# Altium project Custom_Keyboard.PrjPcb (part 3 of 4)

## Sheet Mux_Sheet_1.SchDoc
size A4; SheetNumber: 8
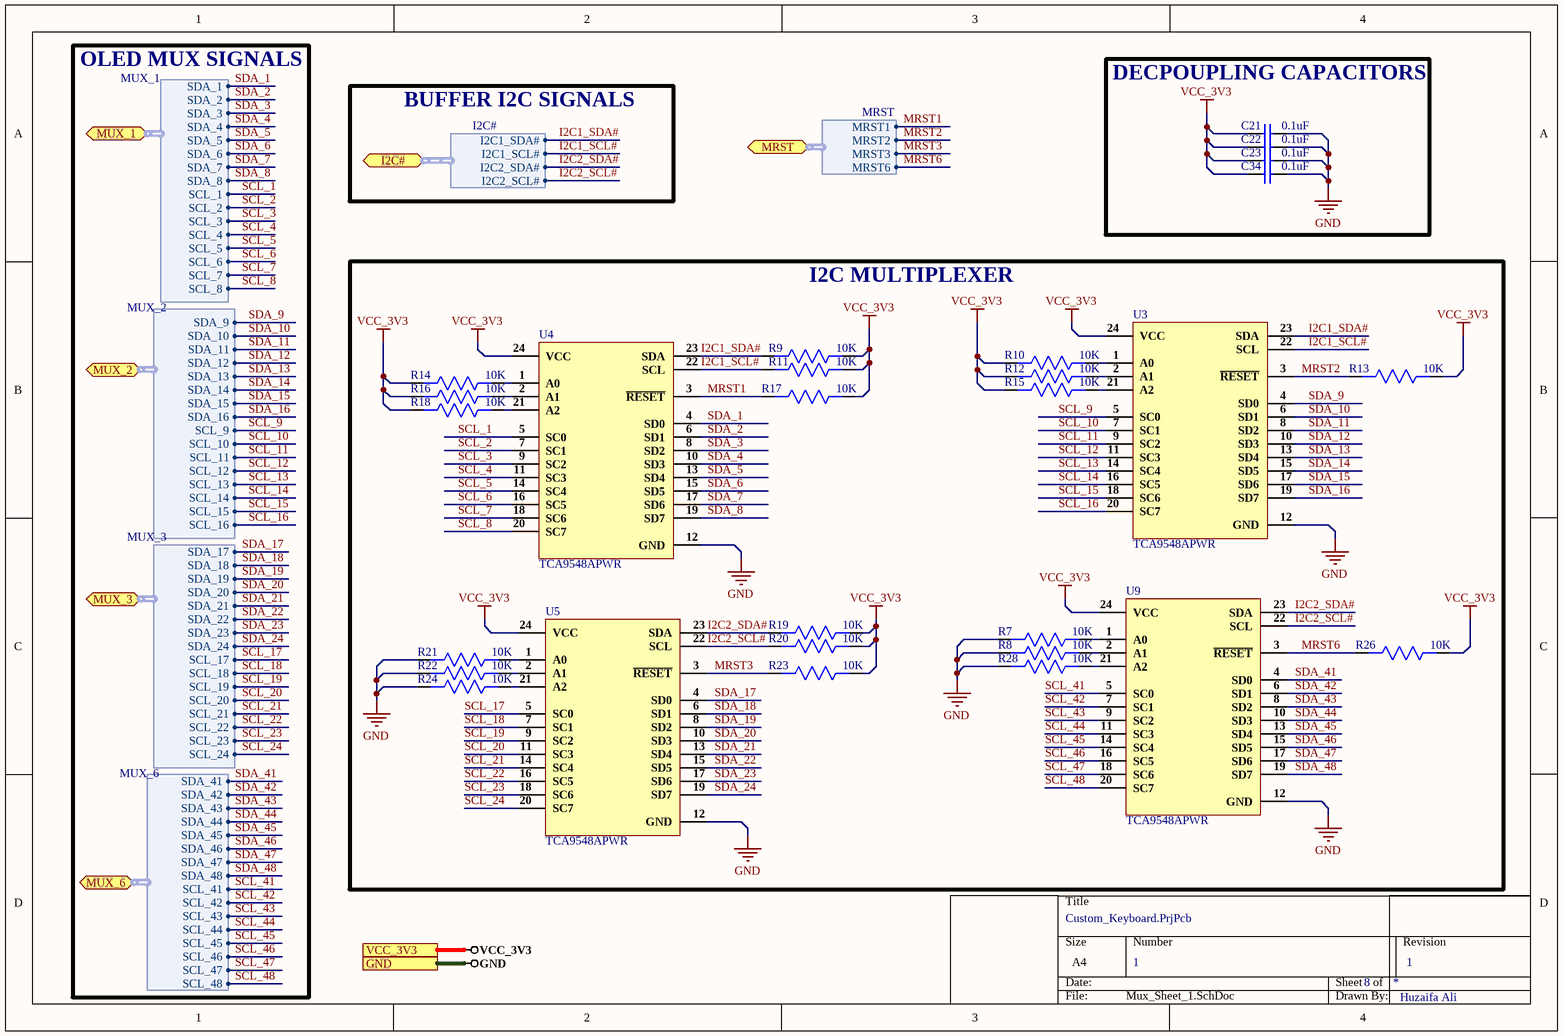
[diagram p9: Mux_Sheet_1.SchDoc]

### Parts
C21  0.1uF  [Cap0603]
C22  0.1uF  [Cap0603]
C23  0.1uF  [Cap0603]
C34  0.1uF  [Cap0603]
R7  10K  [Res0603]
R8  10K  [Res0603]
R9  10K  [Res0603]
R10  10K  [Res0603]
R11  10K  [Res0603]
R12  10K  [Res0603]
R13  10K  [Res0603]
R14  10K  [Res0603]
R15  10K  [Res0603]
R16  10K  [Res0603]
R17  10K  [Res0603]
R18  10K  [Res0603]
R19  10K  [Res0603]
R20  10K  [Res0603]
R21  10K  [Res0603]
R22  10K  [Res0603]
R23  10K  [Res0603]
R24  10K  [Res0603]
R26  10K  [Res0603]
R28  10K  [Res0603]
U3  TCA9548APWR  [24-TSSOP]
U4  TCA9548APWR  [24-TSSOP]
U5  TCA9548APWR  [24-TSSOP]
U9  TCA9548APWR  [24-TSSOP]

### Blocks framed on the sheet
DECPOUPLING CAPACITORS: C21-C23 C34
I2C MULTIPLEXER: R7-R24 R26 R28 U3-U5 U9

### Ports
GND, I2C# (bidir, harness I2C#), MRST (bidir, harness MRST), MUX_1 (bidir, harness MUX_1), MUX_2 (bidir, harness MUX_2), MUX_3 (bidir, harness MUX_3), MUX_6 (bidir, harness MUX_6), VCC_3V3

### Harnesses
MUX_1: SDA_1, SDA_2, SDA_3, SDA_4, SDA_5, SDA_6, SDA_7, SDA_8, SCL_1, SCL_2, SCL_3, SCL_4, SCL_5, SCL_6, SCL_7, SCL_8
MUX_2: SDA_9, SDA_10, SDA_11, SDA_12, SDA_13, SDA_14, SDA_15, SDA_16, SCL_9, SCL_10, SCL_11, SCL_12, SCL_13, SCL_14, SCL_15, SCL_16
MUX_3: SDA_17, SDA_18, SDA_19, SDA_20, SDA_21, SDA_22, SDA_23, SDA_24, SCL_17, SCL_18, SCL_19, SCL_20, SCL_21, SCL_22, SCL_23, SCL_24
I2C#: I2C1_SDA#, I2C1_SCL#, I2C2_SDA#, I2C2_SCL#
MRST: MRST1, MRST2, MRST3, MRST6
MUX_6: SDA_41, SDA_42, SDA_43, SDA_44, SDA_45, SDA_46, SDA_47, SDA_48, SCL_41, SCL_42, SCL_43, SCL_44, SCL_45, SCL_46, SCL_47, SCL_48

### Nets
GND: C21.2 C22.2 C23.2 C34.2 R7.2 R8.2 R21.2 R22.2 R24.2 R28.2 U3.12(GND) U4.12(GND) U5.12(GND) U9.12(GND) ; port GND
VCC_3V3: C21.1 C22.1 C23.1 C34.1 R9.1 R10.2 R11.1 R12.2 R13.1 R14.2 R15.2 R16.2 R17.1 R18.2 R19.1 R20.1 R23.1 R26.1 U3.24(VCC) U4.24(VCC) U5.24(VCC) U9.24(VCC) ; port VCC_3V3
I2C1_SCL#: R11.2 U3.22(SCL) U4.22(SCL) ; port I2C#.I2C1_SCL#  [project net I2C#.I2C1_SCL#]
I2C1_SDA#: R9.2 U3.23(SDA) U4.23(SDA) ; port I2C#.I2C1_SDA#  [project net I2C#.I2C1_SDA#]
I2C2_SCL#: R20.2 U5.22(SCL) U9.22(SCL) ; port I2C#.I2C2_SCL#  [project net I2C#.I2C2_SCL#]
I2C2_SDA#: R19.2 U5.23(SDA) U9.23(SDA) ; port I2C#.I2C2_SDA#  [project net I2C#.I2C2_SDA#]
MRST1: R17.2 U4.3(~{RESET}) ; port MRST.MRST1  [project net MRST.MRST1]
MRST2: R13.2 U3.3(~{RESET}) ; port MRST.MRST2  [project net MRST.MRST2]
MRST3: R23.2 U5.3(~{RESET}) ; port MRST.MRST3  [project net MRST.MRST3]
MRST6: R26.2 U9.3(~{RESET}) ; port MRST.MRST6  [project net MRST.MRST6]
SCL_1: U4.5(SC0) ; port MUX_1.SCL_1  [project net MUX_1.SCL_1]
SCL_2: U4.7(SC1) ; port MUX_1.SCL_2  [project net MUX_1.SCL_2]
SCL_3: U4.9(SC2) ; port MUX_1.SCL_3  [project net MUX_1.SCL_3]
SCL_4: U4.11(SC3) ; port MUX_1.SCL_4  [project net MUX_1.SCL_4]
SCL_5: U4.14(SC4) ; port MUX_1.SCL_5  [project net MUX_1.SCL_5]
SCL_6: U4.16(SC5) ; port MUX_1.SCL_6  [project net MUX_1.SCL_6]
SCL_7: U4.18(SC6) ; port MUX_1.SCL_7  [project net MUX_1.SCL_7]
SCL_8: U4.20(SC7) ; port MUX_1.SCL_8  [project net MUX_1.SCL_8]
SCL_9: U3.5(SC0) ; port MUX_2.SCL_9  [project net MUX_2.SCL_9]
SCL_10: U3.7(SC1) ; port MUX_2.SCL_10  [project net MUX_2.SCL_10]
SCL_11: U3.9(SC2) ; port MUX_2.SCL_11  [project net MUX_2.SCL_11]
SCL_12: U3.11(SC3) ; port MUX_2.SCL_12  [project net MUX_2.SCL_12]
SCL_13: U3.14(SC4) ; port MUX_2.SCL_13  [project net MUX_2.SCL_13]
SCL_14: U3.16(SC5) ; port MUX_2.SCL_14  [project net MUX_2.SCL_14]
SCL_15: U3.18(SC6) ; port MUX_2.SCL_15  [project net MUX_2.SCL_15]
SCL_16: U3.20(SC7) ; port MUX_2.SCL_16  [project net MUX_2.SCL_16]
SCL_17: U5.5(SC0) ; port MUX_3.SCL_17  [project net MUX_3.SCL_17]
SCL_18: U5.7(SC1) ; port MUX_3.SCL_18  [project net MUX_3.SCL_18]
SCL_19: U5.9(SC2) ; port MUX_3.SCL_19  [project net MUX_3.SCL_19]
SCL_20: U5.11(SC3) ; port MUX_3.SCL_20  [project net MUX_3.SCL_20]
SCL_21: U5.14(SC4) ; port MUX_3.SCL_21  [project net MUX_3.SCL_21]
SCL_22: U5.16(SC5) ; port MUX_3.SCL_22  [project net MUX_3.SCL_22]
SCL_23: U5.18(SC6) ; port MUX_3.SCL_23  [project net MUX_3.SCL_23]
SCL_24: U5.20(SC7) ; port MUX_3.SCL_24  [project net MUX_3.SCL_24]
SCL_41: U9.5(SC0) ; port MUX_6.SCL_41  [project net MUX_6.SCL_41]
SCL_42: U9.7(SC1) ; port MUX_6.SCL_42  [project net MUX_6.SCL_42]
SCL_43: U9.9(SC2) ; port MUX_6.SCL_43  [project net MUX_6.SCL_43]
SCL_44: U9.11(SC3) ; port MUX_6.SCL_44  [project net MUX_6.SCL_44]
SCL_45: U9.14(SC4) ; port MUX_6.SCL_45  [project net MUX_6.SCL_45]
SCL_46: U9.16(SC5) ; port MUX_6.SCL_46  [project net MUX_6.SCL_46]
SCL_47: U9.18(SC6) ; port MUX_6.SCL_47  [project net MUX_6.SCL_47]
SCL_48: U9.20(SC7) ; port MUX_6.SCL_48  [project net MUX_6.SCL_48]
SDA_1: U4.4(SD0) ; port MUX_1.SDA_1  [project net MUX_1.SDA_1]
SDA_2: U4.6(SD1) ; port MUX_1.SDA_2  [project net MUX_1.SDA_2]
SDA_3: U4.8(SD2) ; port MUX_1.SDA_3  [project net MUX_1.SDA_3]
SDA_4: U4.10(SD3) ; port MUX_1.SDA_4  [project net MUX_1.SDA_4]
SDA_5: U4.13(SD4) ; port MUX_1.SDA_5  [project net MUX_1.SDA_5]
SDA_6: U4.15(SD5) ; port MUX_1.SDA_6  [project net MUX_1.SDA_6]
SDA_7: U4.17(SD6) ; port MUX_1.SDA_7  [project net MUX_1.SDA_7]
SDA_8: U4.19(SD7) ; port MUX_1.SDA_8  [project net MUX_1.SDA_8]
SDA_9: U3.4(SD0) ; port MUX_2.SDA_9  [project net MUX_2.SDA_9]
SDA_10: U3.6(SD1) ; port MUX_2.SDA_10  [project net MUX_2.SDA_10]
SDA_11: U3.8(SD2) ; port MUX_2.SDA_11  [project net MUX_2.SDA_11]
SDA_12: U3.10(SD3) ; port MUX_2.SDA_12  [project net MUX_2.SDA_12]
SDA_13: U3.13(SD4) ; port MUX_2.SDA_13  [project net MUX_2.SDA_13]
SDA_14: U3.15(SD5) ; port MUX_2.SDA_14  [project net MUX_2.SDA_14]
SDA_15: U3.17(SD6) ; port MUX_2.SDA_15  [project net MUX_2.SDA_15]
SDA_16: U3.19(SD7) ; port MUX_2.SDA_16  [project net MUX_2.SDA_16]
SDA_17: U5.4(SD0) ; port MUX_3.SDA_17  [project net MUX_3.SDA_17]
SDA_18: U5.6(SD1) ; port MUX_3.SDA_18  [project net MUX_3.SDA_18]
SDA_19: U5.8(SD2) ; port MUX_3.SDA_19  [project net MUX_3.SDA_19]
SDA_20: U5.10(SD3) ; port MUX_3.SDA_20  [project net MUX_3.SDA_20]
SDA_21: U5.13(SD4) ; port MUX_3.SDA_21  [project net MUX_3.SDA_21]
SDA_22: U5.15(SD5) ; port MUX_3.SDA_22  [project net MUX_3.SDA_22]
SDA_23: U5.17(SD6) ; port MUX_3.SDA_23  [project net MUX_3.SDA_23]
SDA_24: U5.19(SD7) ; port MUX_3.SDA_24  [project net MUX_3.SDA_24]
SDA_41: U9.4(SD0) ; port MUX_6.SDA_41  [project net MUX_6.SDA_41]
SDA_42: U9.6(SD1) ; port MUX_6.SDA_42  [project net MUX_6.SDA_42]
SDA_43: U9.8(SD2) ; port MUX_6.SDA_43  [project net MUX_6.SDA_43]
SDA_44: U9.10(SD3) ; port MUX_6.SDA_44  [project net MUX_6.SDA_44]
SDA_45: U9.13(SD4) ; port MUX_6.SDA_45  [project net MUX_6.SDA_45]
SDA_46: U9.15(SD5) ; port MUX_6.SDA_46  [project net MUX_6.SDA_46]
SDA_47: U9.17(SD6) ; port MUX_6.SDA_47  [project net MUX_6.SDA_47]
SDA_48: U9.19(SD7) ; port MUX_6.SDA_48  [project net MUX_6.SDA_48]
NetR7_1: R7.1 U9.1(A0)
NetR8_1: R8.1 U9.2(A1)
NetR10_1: R10.1 U3.1(A0)
NetR12_1: R12.1 U3.2(A1)
NetR14_1: R14.1 U4.1(A0)
NetR15_1: R15.1 U3.21(A2)
NetR16_1: R16.1 U4.2(A1)
NetR18_1: R18.1 U4.21(A2)
NetR21_1: R21.1 U5.1(A0)
NetR22_1: R22.1 U5.2(A1)
NetR24_1: R24.1 U5.21(A2)
NetR28_1: R28.1 U9.21(A2)

### Notes on the sheet
- OLED MUX SIGNALS
- BUFFER I2C SIGNALS
- 1
- Huzaifa Ali

### Library data of the parts
C21-C23 C34 = CC0603ZRY5V9BB104: as C3 on sheet Controller_Section_1; Supplier 1: Digi-Key; Manufacturer Part Number: CC0603ZRY5V9BB104; Stock 1: 15000880; Pricing 1: 1=0.1, 10=0.075, 100=0.0334, 500=0.02386, 1000=0.01874 (USD); Mount: Surface Mount; Case/Package: 0603; Number of Pins: 2; Case Code (Metric): 1608; Case Code (Imperial): 0603; Min Operating Temperature: -30°C; Max Operating Temperature: 85°C; Dielectric: Y5V; Voltage Rating: 50V; Package Quantity: 1; Packaging: Tape and Reel; Voltage Rating (DC): 50V; Termination: SMD/SMT; Composition: Ceramic; Voltage: 50V; Length: 1.6mm; Height: 0.8mm; Width: 0.031inch; Thickness: 0.035inch; Depth: 0.8mm; Radiation Hardening: No; REACH SVHC: No SVHC; Lead Free: Lead Free; Halogen Free: Halogen Free; ComponentLink1URL: http://www.yageo.com/documents/recent/UPY-GPHC_Y5V_6.3V-to-50V_8.pdf?src-supplier=Digi-Key; ComponentLink1Description: http://www.yageo.com/documents/recent/UPY-GPHC_Y5V_6.3V-to-50V_8.pdf?src-supplier=Digi-Key; ComponentLink2URL: http://www.yageo.com/documents/recent/UPY-GPHC_Y5V_6.3V-to-50V_5.pdf?src-supplier=Avnet+Europe; ComponentLink2Description: http://www.yageo.com/documents/recent/UPY-GPHC_Y5V_6.3V-to-50V_5.pdf?src-supplier=Avnet+Europe; ComponentLink3URL: https://www.verical.com/server-webapp/html/getDatasheet?partID=403611&src-supplier=Verical; ComponentLink3Description: https://www.verical.com/server-webapp/html/getDatasheet?partID=403611&src-supplier=Verical; ComponentLink4URL: http://www.mouser.com/ds/2/447/Yageo_UPY-GP_NP0_16V-to-50V_9-358835.pdf?src-supplier=Mouser; ComponentLink4Description: http://www.mouser.com/ds/2/447/Yageo_UPY-GP_NP0_16V-to-50V_9-358835.pdf?src-supplier=Mouser; ComponentLink5URL: http://www.farnell.com/datasheets/1132289.pdf?src-supplier=Element14; ComponentLink5Description: http://www.farnell.com/datasheets/1132289.pdf?src-supplier=Element14; Supplier Part Number 1: 311-1343-1-ND
R7-R24 R26 R28 = AC0603JR-0710KL: as R2 on sheet Controller_Section_1; Supplier 1: Future Electronics; Manufacturer Part Number: AC0603JR-0710KL; RoHS: Yes; Category: Chip SMD Resistors; Stock 1: 1533000; Pricing 1: 5000=0.00540 (USD); Case/Package: 0603; Case Code (Imperial): 0603; Case Code (Metric): 1608; Size Code: 0603; Min Operating Temperature: -55°C; Max Operating Temperature: 155°C; Packaging: Tape and Reel; Tolerance: 5%; Package Quantity: 1; Resistor Type: Thick Film; Termination: SMD/SMT; Number of Terminations: 2; Max Power Dissipation: 100mW; Features: Moisture Resistant,Automotive AEC-Q200,Anti-Sulfur; Series: AC; Construction: Rectangular; Length: 0.063inch; Width: 0.031inch; Height: 0.022inch; Depth: 0.8mm; Military Standard: Not; Lead Free: Lead Free; RoHS Compliant: Yes; ComponentLink1URL: https://datasheet.ciiva.com/5562/pyu-ac-51-rohs-l-2-5562553.pdf?src-supplier=Mouser; ComponentLink1Description: https://datasheet.ciiva.com/5562/pyu-ac-51-rohs-l-2-5562553.pdf?src-supplier=Mouser; Supplier Part Number 1: 1029044
U3-U5 U9 = TCA9548APWR: IC BUS SWITCH 1 X 8:1 24TSSOP; Manufacturer: Texas Instruments; Max Supply Voltage: 5.5V; Min Supply Voltage: 1.65V; On-State Resistance: 70R; Max Supply Current: 80uA; Supply Type: Single; Independent Circuits: 1; Supplier 1: Digi-Key; Manufacturer Part Number: TCA9548APWR; RoHS: Yes; Category: Decoders and Multiplexers; Pricing 1: 1=2.09000, 10=1.87600, 25=1.77040, 100=1.50820, 250=1.41616, 500=1.23914, 1000=1.16900 (USD); Mount: Surface Mount; Case/Package: TSSOP; Number of Pins: 24; Contact Plating: Gold; Min Operating Temperature: -40°C; Max Operating Temperature: 85°C; Packaging: Tape and Reel; Package Quantity: 1; REACH SVHC: No SVHC; Lead Free: Lead Free; ComponentLink1URL: https://datasheet.ciiva.com/6614/tca9548a-6614721.pdf?src-supplier=Digi-Key; ComponentLink1Description: https://datasheet.ciiva.com/6614/tca9548a-6614721.pdf?src-supplier=Digi-Key; Supplier Part Number 1: 296-34905-1-ND

## Sheet Mux_Sheet_2.SchDoc
size A4; SheetNumber: 9
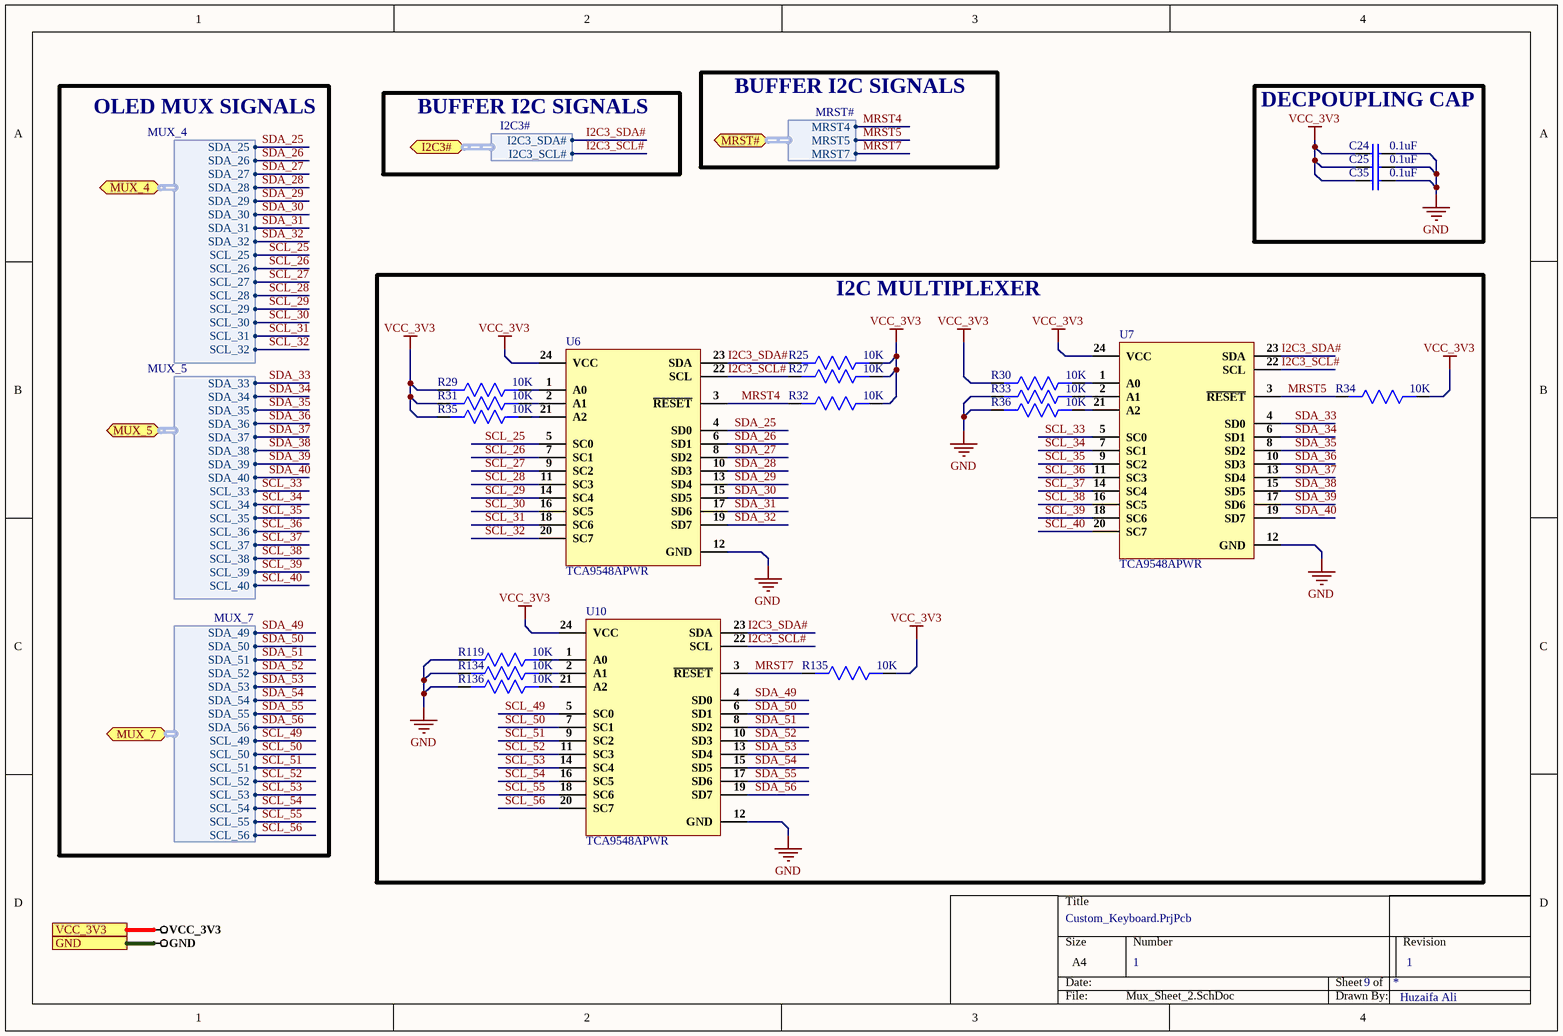
[diagram p10: Mux_Sheet_2.SchDoc]

### Parts
C24  0.1uF  [Cap0603]
C25  0.1uF  [Cap0603]
C35  0.1uF  [Cap0603]
R25  10K  [Res0603]
R27  10K  [Res0603]
R29  10K  [Res0603]
R30  10K  [Res0603]
R31  10K  [Res0603]
R32  10K  [Res0603]
R33  10K  [Res0603]
R34  10K  [Res0603]
R35  10K  [Res0603]
R36  10K  [Res0603]
R119  10K  [Res0603]
R134  10K  [Res0603]
R135  10K  [Res0603]
R136  10K  [Res0603]
U6  TCA9548APWR  [24-TSSOP]
U7  TCA9548APWR  [24-TSSOP]
U10  TCA9548APWR  [24-TSSOP]

### Blocks framed on the sheet
DECPOUPLING CAP: C24 C25 C35
I2C MULTIPLEXER: R25 R27 R29-R36 R119 R134-R136 U6 U7 U10

### Ports
GND, I2C3# (bidir, harness I2C3#), MRST# (bidir, harness MRST#), MUX_4 (bidir, harness MUX_4), MUX_5 (bidir, harness MUX_5), MUX_7 (bidir, harness MUX_7), VCC_3V3

### Harnesses
MUX_4: SDA_25, SDA_26, SDA_27, SDA_28, SDA_29, SDA_30, SDA_31, SDA_32, SCL_25, SCL_26, SCL_27, SCL_28, SCL_29, SCL_30, SCL_31, SCL_32
I2C3#: I2C3_SDA#, I2C3_SCL#
MUX_5: SDA_33, SDA_34, SDA_35, SDA_36, SDA_37, SDA_38, SDA_39, SDA_40, SCL_33, SCL_34, SCL_35, SCL_36, SCL_37, SCL_38, SCL_39, SCL_40
MUX_7: SDA_49, SDA_50, SDA_51, SDA_52, SDA_53, SDA_54, SDA_55, SDA_56, SCL_49, SCL_50, SCL_51, SCL_52, SCL_53, SCL_54, SCL_55, SCL_56
MRST#: MRST4, MRST5, MRST7

### Nets
GND: C24.2 C25.2 C35.2 R33.2 R36.2 R119.2 R134.2 R136.2 U6.12(GND) U7.12(GND) U10.12(GND) ; port GND
VCC_3V3: C24.1 C25.1 C35.1 R25.1 R27.1 R29.2 R30.2 R31.2 R32.1 R34.1 R35.2 R135.1 U6.24(VCC) U7.24(VCC) U10.24(VCC) ; port VCC_3V3
I2C3_SCL#: R27.2 U6.22(SCL) U7.22(SCL) U10.22(SCL) ; port I2C3#.I2C3_SCL#  [project net I2C3#.I2C3_SCL#]
I2C3_SDA#: R25.2 U6.23(SDA) U7.23(SDA) U10.23(SDA) ; port I2C3#.I2C3_SDA#  [project net I2C3#.I2C3_SDA#]
MRST4: R32.2 U6.3(~{RESET}) ; port MRST#.MRST4  [project net MRST#.MRST4]
MRST5: R34.2 U7.3(~{RESET}) ; port MRST#.MRST5  [project net MRST#.MRST5]
MRST7: R135.2 U10.3(~{RESET}) ; port MRST#.MRST7  [project net MRST#.MRST7]
SCL_25: U6.5(SC0) ; port MUX_4.SCL_25  [project net MUX_4.SCL_25]
SCL_26: U6.7(SC1) ; port MUX_4.SCL_26  [project net MUX_4.SCL_26]
SCL_27: U6.9(SC2) ; port MUX_4.SCL_27  [project net MUX_4.SCL_27]
SCL_28: U6.11(SC3) ; port MUX_4.SCL_28  [project net MUX_4.SCL_28]
SCL_29: U6.14(SC4) ; port MUX_4.SCL_29  [project net MUX_4.SCL_29]
SCL_30: U6.16(SC5) ; port MUX_4.SCL_30  [project net MUX_4.SCL_30]
SCL_31: U6.18(SC6) ; port MUX_4.SCL_31  [project net MUX_4.SCL_31]
SCL_32: U6.20(SC7) ; port MUX_4.SCL_32  [project net MUX_4.SCL_32]
SCL_33: U7.5(SC0) ; port MUX_5.SCL_33  [project net MUX_5.SCL_33]
SCL_34: U7.7(SC1) ; port MUX_5.SCL_34  [project net MUX_5.SCL_34]
SCL_35: U7.9(SC2) ; port MUX_5.SCL_35  [project net MUX_5.SCL_35]
SCL_36: U7.11(SC3) ; port MUX_5.SCL_36  [project net MUX_5.SCL_36]
SCL_37: U7.14(SC4) ; port MUX_5.SCL_37  [project net MUX_5.SCL_37]
SCL_38: U7.16(SC5) ; port MUX_5.SCL_38  [project net MUX_5.SCL_38]
SCL_39: U7.18(SC6) ; port MUX_5.SCL_39  [project net MUX_5.SCL_39]
SCL_40: U7.20(SC7) ; port MUX_5.SCL_40  [project net MUX_5.SCL_40]
SCL_49: U10.5(SC0) ; port MUX_7.SCL_49  [project net MUX_7.SCL_49]
SCL_50: U10.7(SC1) ; port MUX_7.SCL_50  [project net MUX_7.SCL_50]
SCL_51: U10.9(SC2) ; port MUX_7.SCL_51  [project net MUX_7.SCL_51]
SCL_52: U10.11(SC3) ; port MUX_7.SCL_52  [project net MUX_7.SCL_52]
SCL_53: U10.14(SC4) ; port MUX_7.SCL_53  [project net MUX_7.SCL_53]
SCL_54: U10.16(SC5) ; port MUX_7.SCL_54  [project net MUX_7.SCL_54]
SCL_55: U10.18(SC6) ; port MUX_7.SCL_55  [project net MUX_7.SCL_55]
SCL_56: U10.20(SC7) ; port MUX_7.SCL_56  [project net MUX_7.SCL_56]
SDA_25: U6.4(SD0) ; port MUX_4.SDA_25  [project net MUX_4.SDA_25]
SDA_26: U6.6(SD1) ; port MUX_4.SDA_26  [project net MUX_4.SDA_26]
SDA_27: U6.8(SD2) ; port MUX_4.SDA_27  [project net MUX_4.SDA_27]
SDA_28: U6.10(SD3) ; port MUX_4.SDA_28  [project net MUX_4.SDA_28]
SDA_29: U6.13(SD4) ; port MUX_4.SDA_29  [project net MUX_4.SDA_29]
SDA_30: U6.15(SD5) ; port MUX_4.SDA_30  [project net MUX_4.SDA_30]
SDA_31: U6.17(SD6) ; port MUX_4.SDA_31  [project net MUX_4.SDA_31]
SDA_32: U6.19(SD7) ; port MUX_4.SDA_32  [project net MUX_4.SDA_32]
SDA_33: U7.4(SD0) ; port MUX_5.SDA_33  [project net MUX_5.SDA_33]
SDA_34: U7.6(SD1) ; port MUX_5.SDA_34  [project net MUX_5.SDA_34]
SDA_35: U7.8(SD2) ; port MUX_5.SDA_35  [project net MUX_5.SDA_35]
SDA_36: U7.10(SD3) ; port MUX_5.SDA_36  [project net MUX_5.SDA_36]
SDA_37: U7.13(SD4) ; port MUX_5.SDA_37  [project net MUX_5.SDA_37]
SDA_38: U7.15(SD5) ; port MUX_5.SDA_38  [project net MUX_5.SDA_38]
SDA_39: U7.17(SD6) ; port MUX_5.SDA_39  [project net MUX_5.SDA_39]
SDA_40: U7.19(SD7) ; port MUX_5.SDA_40  [project net MUX_5.SDA_40]
SDA_49: U10.4(SD0) ; port MUX_7.SDA_49  [project net MUX_7.SDA_49]
SDA_50: U10.6(SD1) ; port MUX_7.SDA_50  [project net MUX_7.SDA_50]
SDA_51: U10.8(SD2) ; port MUX_7.SDA_51  [project net MUX_7.SDA_51]
SDA_52: U10.10(SD3) ; port MUX_7.SDA_52  [project net MUX_7.SDA_52]
SDA_53: U10.13(SD4) ; port MUX_7.SDA_53  [project net MUX_7.SDA_53]
SDA_54: U10.15(SD5) ; port MUX_7.SDA_54  [project net MUX_7.SDA_54]
SDA_55: U10.17(SD6) ; port MUX_7.SDA_55  [project net MUX_7.SDA_55]
SDA_56: U10.19(SD7) ; port MUX_7.SDA_56  [project net MUX_7.SDA_56]
NetR29_1: R29.1 U6.1(A0)
NetR30_1: R30.1 U7.1(A0)
NetR31_1: R31.1 U6.2(A1)
NetR33_1: R33.1 U7.2(A1)
NetR35_1: R35.1 U6.21(A2)
NetR36_1: R36.1 U7.21(A2)
NetR119_1: R119.1 U10.1(A0)
NetR134_1: R134.1 U10.2(A1)
NetR136_1: R136.1 U10.21(A2)

### Notes on the sheet
- OLED MUX SIGNALS
- BUFFER I2C SIGNALS
- 1
- Huzaifa Ali

### Library data of the parts
C24 C25 C35 = CC0603ZRY5V9BB104: as C3 on sheet Controller_Section_1; Supplier 1: Digi-Key; Manufacturer Part Number: CC0603ZRY5V9BB104; Stock 1: 15000880; Pricing 1: 1=0.1, 10=0.075, 100=0.0334, 500=0.02386, 1000=0.01874 (USD); Mount: Surface Mount; Case/Package: 0603; Number of Pins: 2; Case Code (Metric): 1608; Case Code (Imperial): 0603; Min Operating Temperature: -30°C; Max Operating Temperature: 85°C; Dielectric: Y5V; Voltage Rating: 50V; Package Quantity: 1; Packaging: Tape and Reel; Voltage Rating (DC): 50V; Termination: SMD/SMT; Composition: Ceramic; Voltage: 50V; Length: 1.6mm; Height: 0.8mm; Width: 0.031inch; Thickness: 0.035inch; Depth: 0.8mm; Radiation Hardening: No; REACH SVHC: No SVHC; Lead Free: Lead Free; Halogen Free: Halogen Free; ComponentLink1URL: http://www.yageo.com/documents/recent/UPY-GPHC_Y5V_6.3V-to-50V_8.pdf?src-supplier=Digi-Key; ComponentLink1Description: http://www.yageo.com/documents/recent/UPY-GPHC_Y5V_6.3V-to-50V_8.pdf?src-supplier=Digi-Key; ComponentLink2URL: http://www.yageo.com/documents/recent/UPY-GPHC_Y5V_6.3V-to-50V_5.pdf?src-supplier=Avnet+Europe; ComponentLink2Description: http://www.yageo.com/documents/recent/UPY-GPHC_Y5V_6.3V-to-50V_5.pdf?src-supplier=Avnet+Europe; ComponentLink3URL: https://www.verical.com/server-webapp/html/getDatasheet?partID=403611&src-supplier=Verical; ComponentLink3Description: https://www.verical.com/server-webapp/html/getDatasheet?partID=403611&src-supplier=Verical; ComponentLink4URL: http://www.mouser.com/ds/2/447/Yageo_UPY-GP_NP0_16V-to-50V_9-358835.pdf?src-supplier=Mouser; ComponentLink4Description: http://www.mouser.com/ds/2/447/Yageo_UPY-GP_NP0_16V-to-50V_9-358835.pdf?src-supplier=Mouser; ComponentLink5URL: http://www.farnell.com/datasheets/1132289.pdf?src-supplier=Element14; ComponentLink5Description: http://www.farnell.com/datasheets/1132289.pdf?src-supplier=Element14; Supplier Part Number 1: 311-1343-1-ND
R25 R27 R29-R36 R119 R134-R136 = AC0603JR-0710KL: as R2 on sheet Controller_Section_1; Supplier 1: Future Electronics; Manufacturer Part Number: AC0603JR-0710KL; RoHS: Yes; Category: Chip SMD Resistors; Stock 1: 1533000; Pricing 1: 5000=0.00540 (USD); Case/Package: 0603; Case Code (Imperial): 0603; Case Code (Metric): 1608; Size Code: 0603; Min Operating Temperature: -55°C; Max Operating Temperature: 155°C; Packaging: Tape and Reel; Tolerance: 5%; Package Quantity: 1; Resistor Type: Thick Film; Termination: SMD/SMT; Number of Terminations: 2; Max Power Dissipation: 100mW; Features: Moisture Resistant,Automotive AEC-Q200,Anti-Sulfur; Series: AC; Construction: Rectangular; Length: 0.063inch; Width: 0.031inch; Height: 0.022inch; Depth: 0.8mm; Military Standard: Not; Lead Free: Lead Free; RoHS Compliant: Yes; ComponentLink1URL: https://datasheet.ciiva.com/5562/pyu-ac-51-rohs-l-2-5562553.pdf?src-supplier=Mouser; ComponentLink1Description: https://datasheet.ciiva.com/5562/pyu-ac-51-rohs-l-2-5562553.pdf?src-supplier=Mouser; Supplier Part Number 1: 1029044
U6 U7 U10 = TCA9548APWR: as U3 on sheet Mux_Sheet_1; Supplier 1: Digi-Key; Manufacturer Part Number: TCA9548APWR; RoHS: Yes; Category: Decoders and Multiplexers; Pricing 1: 1=2.09000, 10=1.87600, 25=1.77040, 100=1.50820, 250=1.41616, 500=1.23914, 1000=1.16900 (USD); Mount: Surface Mount; Case/Package: TSSOP; Number of Pins: 24; Contact Plating: Gold; Min Operating Temperature: -40°C; Max Operating Temperature: 85°C; Packaging: Tape and Reel; Package Quantity: 1; REACH SVHC: No SVHC; Lead Free: Lead Free; ComponentLink1URL: https://datasheet.ciiva.com/6614/tca9548a-6614721.pdf?src-supplier=Digi-Key; ComponentLink1Description: https://datasheet.ciiva.com/6614/tca9548a-6614721.pdf?src-supplier=Digi-Key; Supplier Part Number 1: 296-34905-1-ND

## Sheet RPull_Section.SchDoc
size A4; SheetNumber: 10
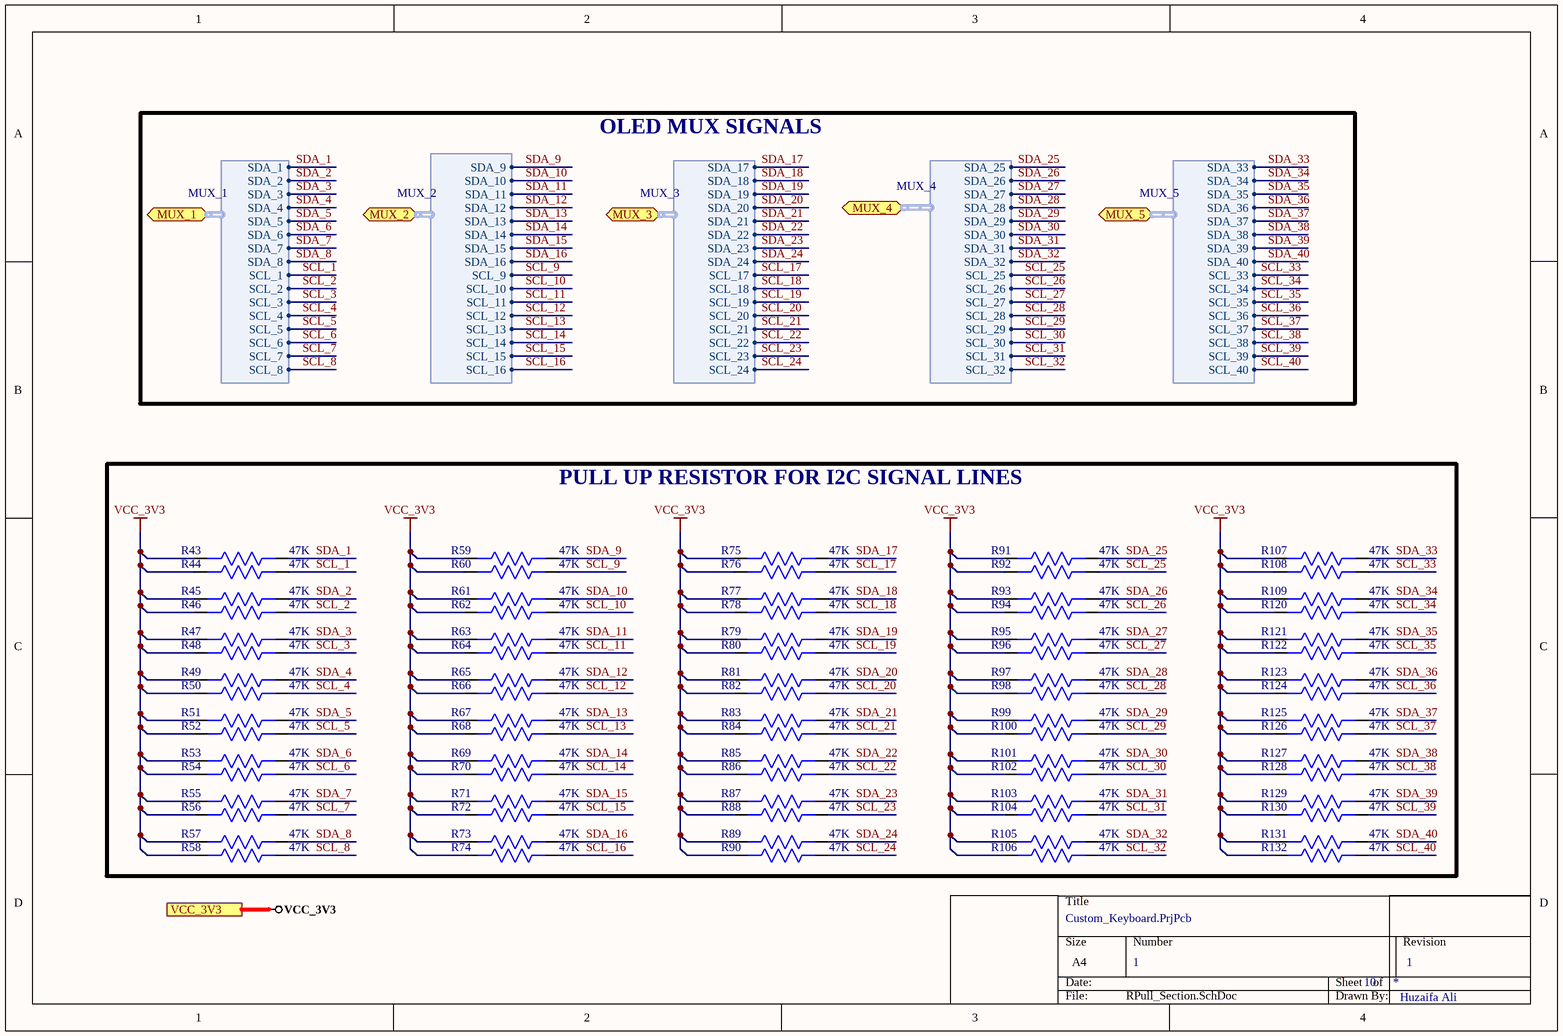
[diagram p11: RPull_Section.SchDoc]

### Parts
R43  47K  [Res0402]
R44  47K  [Res0402]
R45  47K  [Res0402]
R46  47K  [Res0402]
R47  47K  [Res0402]
R48  47K  [Res0402]
R49  47K  [Res0402]
R50  47K  [Res0402]
R51  47K  [Res0402]
R52  47K  [Res0402]
R53  47K  [Res0402]
R54  47K  [Res0402]
R55  47K  [Res0402]
R56  47K  [Res0402]
R57  47K  [Res0402]
R58  47K  [Res0402]
R59  47K  [Res0402]
R60  47K  [Res0402]
R61  47K  [Res0402]
R62  47K  [Res0402]
R63  47K  [Res0402]
R64  47K  [Res0402]
R65  47K  [Res0402]
R66  47K  [Res0402]
R67  47K  [Res0402]
R68  47K  [Res0402]
R69  47K  [Res0402]
R70  47K  [Res0402]
R71  47K  [Res0402]
R72  47K  [Res0402]
R73  47K  [Res0402]
R74  47K  [Res0402]
R75  47K  [Res0402]
R76  47K  [Res0402]
R77  47K  [Res0402]
R78  47K  [Res0402]
R79  47K  [Res0402]
R80  47K  [Res0402]
R81  47K  [Res0402]
R82  47K  [Res0402]
R83  47K  [Res0402]
R84  47K  [Res0402]
R85  47K  [Res0402]
R86  47K  [Res0402]
R87  47K  [Res0402]
R88  47K  [Res0402]
R89  47K  [Res0402]
R90  47K  [Res0402]
R91  47K  [Res0402]
R92  47K  [Res0402]
R93  47K  [Res0402]
R94  47K  [Res0402]
R95  47K  [Res0402]
R96  47K  [Res0402]
R97  47K  [Res0402]
R98  47K  [Res0402]
R99  47K  [Res0402]
R100  47K  [Res0402]
R101  47K  [Res0402]
R102  47K  [Res0402]
R103  47K  [Res0402]
R104  47K  [Res0402]
R105  47K  [Res0402]
R106  47K  [Res0402]
R107  47K  [Res0402]
R108  47K  [Res0402]
R109  47K  [Res0402]
R120  47K  [Res0402]
R121  47K  [Res0402]
R122  47K  [Res0402]
R123  47K  [Res0402]
R124  47K  [Res0402]
R125  47K  [Res0402]
R126  47K  [Res0402]
R127  47K  [Res0402]
R128  47K  [Res0402]
R129  47K  [Res0402]
R130  47K  [Res0402]
R131  47K  [Res0402]
R132  47K  [Res0402]

### Blocks framed on the sheet
PULL UP RESISTOR FOR I2C SIGNAL LINES: R43-R109 R120-R132

### Ports
MUX_1 (bidir, harness MUX_1), MUX_2 (bidir, harness MUX_2), MUX_3 (bidir, harness MUX_3), MUX_4 (bidir, harness MUX_4), MUX_5 (bidir, harness MUX_5), VCC_3V3

### Harnesses
MUX_4: SDA_25, SDA_26, SDA_27, SDA_28, SDA_29, SDA_30, SDA_31, SDA_32, SCL_25, SCL_26, SCL_27, SCL_28, SCL_29, SCL_30, SCL_31, SCL_32
MUX_5: SDA_33, SDA_34, SDA_35, SDA_36, SDA_37, SDA_38, SDA_39, SDA_40, SCL_33, SCL_34, SCL_35, SCL_36, SCL_37, SCL_38, SCL_39, SCL_40
MUX_1: SDA_1, SDA_2, SDA_3, SDA_4, SDA_5, SDA_6, SDA_7, SDA_8, SCL_1, SCL_2, SCL_3, SCL_4, SCL_5, SCL_6, SCL_7, SCL_8
MUX_2: SDA_9, SDA_10, SDA_11, SDA_12, SDA_13, SDA_14, SDA_15, SDA_16, SCL_9, SCL_10, SCL_11, SCL_12, SCL_13, SCL_14, SCL_15, SCL_16
MUX_3: SDA_17, SDA_18, SDA_19, SDA_20, SDA_21, SDA_22, SDA_23, SDA_24, SCL_17, SCL_18, SCL_19, SCL_20, SCL_21, SCL_22, SCL_23, SCL_24

### Nets
VCC_3V3: R43.2 R44.2 R45.2 R46.2 R47.2 R48.2 R49.2 R50.2 R51.2 R52.2 R53.2 R54.2 R55.2 R56.2 R57.2 R58.2 R59.2 R60.2 R61.2 R62.2 R63.2 R64.2 R65.2 R66.2 R67.2 R68.2 R69.2 R70.2 R71.2 R72.2 R73.2 R74.2 R75.2 R76.2 R77.2 R78.2 R79.2 R80.2 R81.2 R82.2 R83.2 R84.2 R85.2 R86.2 R87.2 R88.2 R89.2 R90.2 R91.2 R92.2 R93.2 R94.2 R95.2 R96.2 R97.2 R98.2 R99.2 R100.2 R101.2 R102.2 R103.2 R104.2 R105.2 R106.2 R107.2 R108.2 R109.2 R120.2 R121.2 R122.2 R123.2 R124.2 R125.2 R126.2 R127.2 R128.2 R129.2 R130.2 R131.2 R132.2 ; port VCC_3V3
SCL_1: R44.1 ; port MUX_1.SCL_1  [project net MUX_1.SCL_1]
SCL_2: R46.1 ; port MUX_1.SCL_2  [project net MUX_1.SCL_2]
SCL_3: R48.1 ; port MUX_1.SCL_3  [project net MUX_1.SCL_3]
SCL_4: R50.1 ; port MUX_1.SCL_4  [project net MUX_1.SCL_4]
SCL_5: R52.1 ; port MUX_1.SCL_5  [project net MUX_1.SCL_5]
SCL_6: R54.1 ; port MUX_1.SCL_6  [project net MUX_1.SCL_6]
SCL_7: R56.1 ; port MUX_1.SCL_7  [project net MUX_1.SCL_7]
SCL_8: R58.1 ; port MUX_1.SCL_8  [project net MUX_1.SCL_8]
SCL_9: R60.1 ; port MUX_2.SCL_9  [project net MUX_2.SCL_9]
SCL_10: R62.1 ; port MUX_2.SCL_10  [project net MUX_2.SCL_10]
SCL_11: R64.1 ; port MUX_2.SCL_11  [project net MUX_2.SCL_11]
SCL_12: R66.1 ; port MUX_2.SCL_12  [project net MUX_2.SCL_12]
SCL_13: R68.1 ; port MUX_2.SCL_13  [project net MUX_2.SCL_13]
SCL_14: R70.1 ; port MUX_2.SCL_14  [project net MUX_2.SCL_14]
SCL_15: R72.1 ; port MUX_2.SCL_15  [project net MUX_2.SCL_15]
SCL_16: R74.1 ; port MUX_2.SCL_16  [project net MUX_2.SCL_16]
SCL_17: R76.1 ; port MUX_3.SCL_17  [project net MUX_3.SCL_17]
SCL_18: R78.1 ; port MUX_3.SCL_18  [project net MUX_3.SCL_18]
SCL_19: R80.1 ; port MUX_3.SCL_19  [project net MUX_3.SCL_19]
SCL_20: R82.1 ; port MUX_3.SCL_20  [project net MUX_3.SCL_20]
SCL_21: R84.1 ; port MUX_3.SCL_21  [project net MUX_3.SCL_21]
SCL_22: R86.1 ; port MUX_3.SCL_22  [project net MUX_3.SCL_22]
SCL_23: R88.1 ; port MUX_3.SCL_23  [project net MUX_3.SCL_23]
SCL_24: R90.1 ; port MUX_3.SCL_24  [project net MUX_3.SCL_24]
SCL_25: R92.1 ; port MUX_4.SCL_25  [project net MUX_4.SCL_25]
SCL_26: R94.1 ; port MUX_4.SCL_26  [project net MUX_4.SCL_26]
SCL_27: R96.1 ; port MUX_4.SCL_27  [project net MUX_4.SCL_27]
SCL_28: R98.1 ; port MUX_4.SCL_28  [project net MUX_4.SCL_28]
SCL_29: R100.1 ; port MUX_4.SCL_29  [project net MUX_4.SCL_29]
SCL_30: R102.1 ; port MUX_4.SCL_30  [project net MUX_4.SCL_30]
SCL_31: R104.1 ; port MUX_4.SCL_31  [project net MUX_4.SCL_31]
SCL_32: R106.1 ; port MUX_4.SCL_32  [project net MUX_4.SCL_32]
SCL_33: R108.1 ; port MUX_5.SCL_33  [project net MUX_5.SCL_33]
SCL_34: R120.1 ; port MUX_5.SCL_34  [project net MUX_5.SCL_34]
SCL_35: R122.1 ; port MUX_5.SCL_35  [project net MUX_5.SCL_35]
SCL_36: R124.1 ; port MUX_5.SCL_36  [project net MUX_5.SCL_36]
SCL_37: R126.1 ; port MUX_5.SCL_37  [project net MUX_5.SCL_37]
SCL_38: R128.1 ; port MUX_5.SCL_38  [project net MUX_5.SCL_38]
SCL_39: R130.1 ; port MUX_5.SCL_39  [project net MUX_5.SCL_39]
SCL_40: R132.1 ; port MUX_5.SCL_40  [project net MUX_5.SCL_40]
SDA_1: R43.1 ; port MUX_1.SDA_1  [project net MUX_1.SDA_1]
SDA_2: R45.1 ; port MUX_1.SDA_2  [project net MUX_1.SDA_2]
SDA_3: R47.1 ; port MUX_1.SDA_3  [project net MUX_1.SDA_3]
SDA_4: R49.1 ; port MUX_1.SDA_4  [project net MUX_1.SDA_4]
SDA_5: R51.1 ; port MUX_1.SDA_5  [project net MUX_1.SDA_5]
SDA_6: R53.1 ; port MUX_1.SDA_6  [project net MUX_1.SDA_6]
SDA_7: R55.1 ; port MUX_1.SDA_7  [project net MUX_1.SDA_7]
SDA_8: R57.1 ; port MUX_1.SDA_8  [project net MUX_1.SDA_8]
SDA_9: R59.1 ; port MUX_2.SDA_9  [project net MUX_2.SDA_9]
SDA_10: R61.1 ; port MUX_2.SDA_10  [project net MUX_2.SDA_10]
SDA_11: R63.1 ; port MUX_2.SDA_11  [project net MUX_2.SDA_11]
SDA_12: R65.1 ; port MUX_2.SDA_12  [project net MUX_2.SDA_12]
SDA_13: R67.1 ; port MUX_2.SDA_13  [project net MUX_2.SDA_13]
SDA_14: R69.1 ; port MUX_2.SDA_14  [project net MUX_2.SDA_14]
SDA_15: R71.1 ; port MUX_2.SDA_15  [project net MUX_2.SDA_15]
SDA_16: R73.1 ; port MUX_2.SDA_16  [project net MUX_2.SDA_16]
SDA_17: R75.1 ; port MUX_3.SDA_17  [project net MUX_3.SDA_17]
SDA_18: R77.1 ; port MUX_3.SDA_18  [project net MUX_3.SDA_18]
SDA_19: R79.1 ; port MUX_3.SDA_19  [project net MUX_3.SDA_19]
SDA_20: R81.1 ; port MUX_3.SDA_20  [project net MUX_3.SDA_20]
SDA_21: R83.1 ; port MUX_3.SDA_21  [project net MUX_3.SDA_21]
SDA_22: R85.1 ; port MUX_3.SDA_22  [project net MUX_3.SDA_22]
SDA_23: R87.1 ; port MUX_3.SDA_23  [project net MUX_3.SDA_23]
SDA_24: R89.1 ; port MUX_3.SDA_24  [project net MUX_3.SDA_24]
SDA_25: R91.1 ; port MUX_4.SDA_25  [project net MUX_4.SDA_25]
SDA_26: R93.1 ; port MUX_4.SDA_26  [project net MUX_4.SDA_26]
SDA_27: R95.1 ; port MUX_4.SDA_27  [project net MUX_4.SDA_27]
SDA_28: R97.1 ; port MUX_4.SDA_28  [project net MUX_4.SDA_28]
SDA_29: R99.1 ; port MUX_4.SDA_29  [project net MUX_4.SDA_29]
SDA_30: R101.1 ; port MUX_4.SDA_30  [project net MUX_4.SDA_30]
SDA_31: R103.1 ; port MUX_4.SDA_31  [project net MUX_4.SDA_31]
SDA_32: R105.1 ; port MUX_4.SDA_32  [project net MUX_4.SDA_32]
SDA_33: R107.1 ; port MUX_5.SDA_33  [project net MUX_5.SDA_33]
SDA_34: R109.1 ; port MUX_5.SDA_34  [project net MUX_5.SDA_34]
SDA_35: R121.1 ; port MUX_5.SDA_35  [project net MUX_5.SDA_35]
SDA_36: R123.1 ; port MUX_5.SDA_36  [project net MUX_5.SDA_36]
SDA_37: R125.1 ; port MUX_5.SDA_37  [project net MUX_5.SDA_37]
SDA_38: R127.1 ; port MUX_5.SDA_38  [project net MUX_5.SDA_38]
SDA_39: R129.1 ; port MUX_5.SDA_39  [project net MUX_5.SDA_39]
SDA_40: R131.1 ; port MUX_5.SDA_40  [project net MUX_5.SDA_40]

### Notes on the sheet
- OLED MUX SIGNALS
- 1
- Huzaifa Ali

### Library data of the parts
R43-R109 R120-R132 = RC0402FR-0747KL: RES SMD 47K OHM 1% 1/16W 0402; Manufacturer: Yageo; Power Rating: 62.5mW; Temperature Coefficient: 100ppm/°C; Voltage Rating: 50V; Resistance: 47kR; Max Power Dissipation: 63mW; Supplier 1: Digi-Key; Manufacturer Part Number: RC0402FR-0747KL; Stock 1: 0; Pricing 1: 1=0.1, 10=0.016, 100=0.0064, 1000=0.00289, 2500=0.00251, 5000=0.00207 (USD); Case/Package: 0402; Case Code (Imperial): 0402; Case Code (Metric): 1005; Min Operating Temperature: -55°C; Max Operating Temperature: 155°C; Tolerance: 1%; Packaging: Tape and Reel; Package Quantity: 1; Termination: SMD/SMT; Composition: Thick Film; Number of Terminations: 2; Military Standard: Not; Features: Moisture Resistant; Length: 1mm; Height: 0.016inch; Depth: 0.5mm; Width: 0.5mm; REACH SVHC: Unknown; Lead Free: Lead Free; ComponentLink1URL: http://www.yageo.com/documents/recent/PYu-RC0402_51_RoHS_L_6_r.pdf?src-supplier=Future+Electronics; ComponentLink1Description: http://www.yageo.com/documents/recent/PYu-RC0402_51_RoHS_L_6_r.pdf?src-supplier=Future+Electronics; ComponentLink2URL: http://www.farnell.com/datasheets/1018594.pdf?src-supplier=Element14; ComponentLink2Description: http://www.farnell.com/datasheets/1018594.pdf?src-supplier=Element14; ComponentLink3URL: https://www.verical.com/server-webapp/html/getDatasheet?partID=323748&src-supplier=Verical; ComponentLink3Description: https://www.verical.com/server-webapp/html/getDatasheet?partID=323748&src-supplier=Verical; ComponentLink4URL: http://www.yageo.com/documents/recent/PYu-RC_Group_51_RoHS_L_10.pdf?src-supplier=Digi-Key; ComponentLink4Description: http://www.yageo.com/documents/recent/PYu-RC_Group_51_RoHS_L_10.pdf?src-supplier=Digi-Key; Supplier Part Number 1: 311-47.0KLRDKR-ND

## Sheet Rpull_Section2.SchDoc
size A4
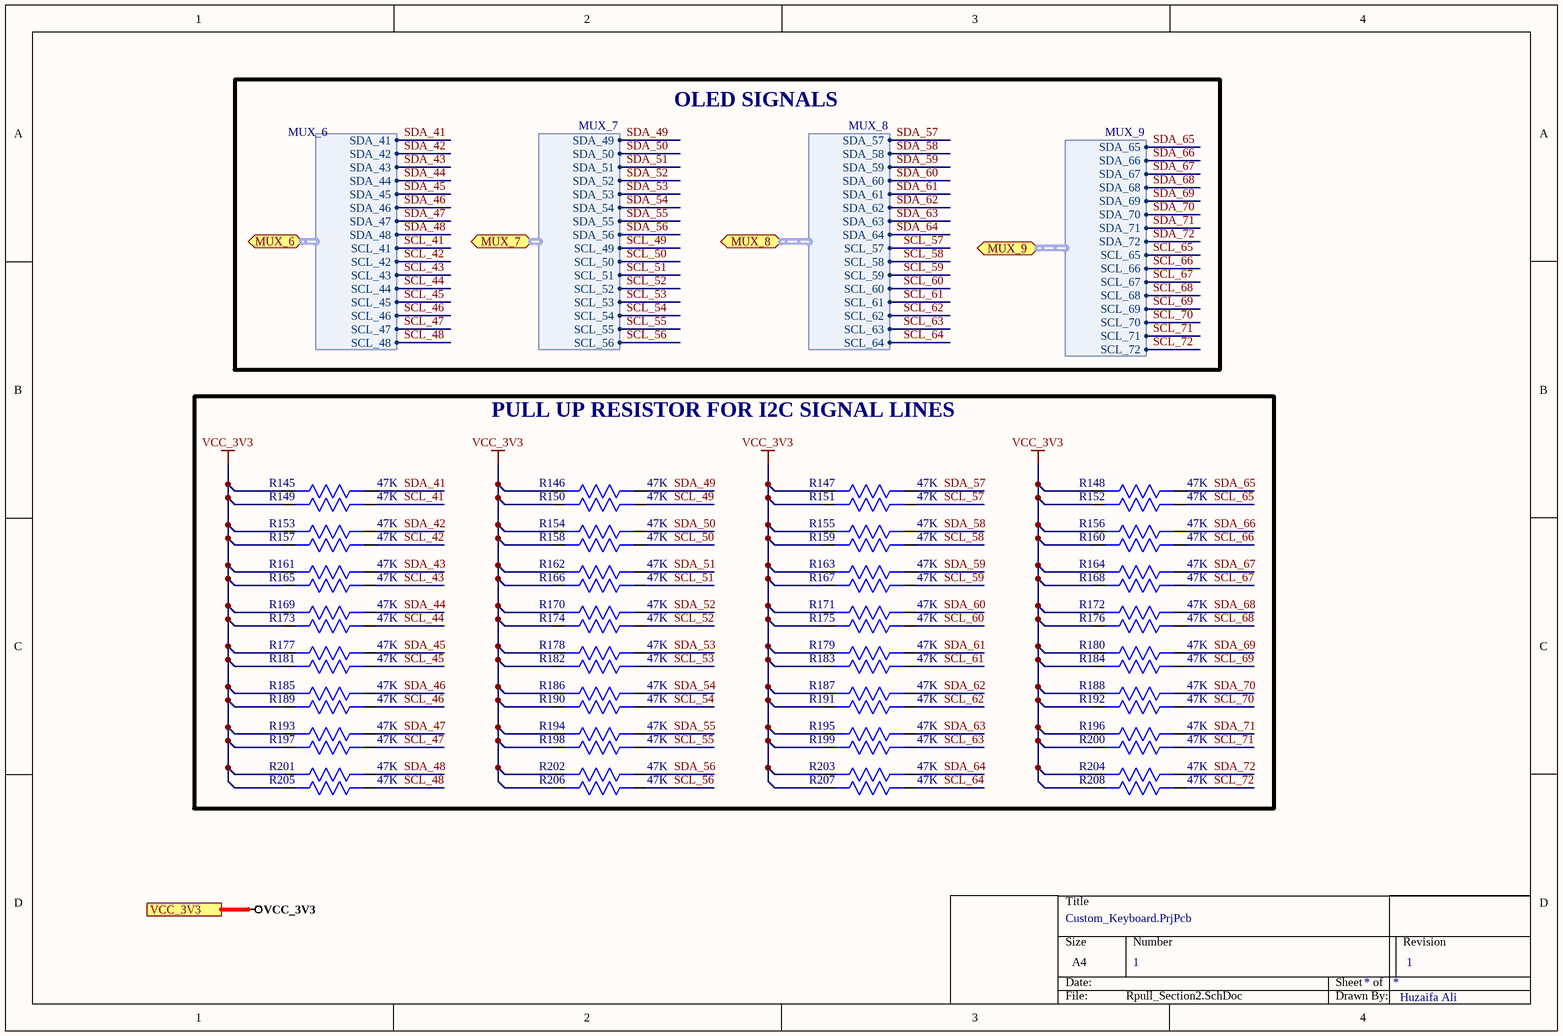
[diagram p12: Rpull_Section2.SchDoc]

### Parts
R145  47K  [Res0402]
R146  47K  [Res0402]
R147  47K  [Res0402]
R148  47K  [Res0402]
R149  47K  [Res0402]
R150  47K  [Res0402]
R151  47K  [Res0402]
R152  47K  [Res0402]
R153  47K  [Res0402]
R154  47K  [Res0402]
R155  47K  [Res0402]
R156  47K  [Res0402]
R157  47K  [Res0402]
R158  47K  [Res0402]
R159  47K  [Res0402]
R160  47K  [Res0402]
R161  47K  [Res0402]
R162  47K  [Res0402]
R163  47K  [Res0402]
R164  47K  [Res0402]
R165  47K  [Res0402]
R166  47K  [Res0402]
R167  47K  [Res0402]
R168  47K  [Res0402]
R169  47K  [Res0402]
R170  47K  [Res0402]
R171  47K  [Res0402]
R172  47K  [Res0402]
R173  47K  [Res0402]
R174  47K  [Res0402]
R175  47K  [Res0402]
R176  47K  [Res0402]
R177  47K  [Res0402]
R178  47K  [Res0402]
R179  47K  [Res0402]
R180  47K  [Res0402]
R181  47K  [Res0402]
R182  47K  [Res0402]
R183  47K  [Res0402]
R184  47K  [Res0402]
R185  47K  [Res0402]
R186  47K  [Res0402]
R187  47K  [Res0402]
R188  47K  [Res0402]
R189  47K  [Res0402]
R190  47K  [Res0402]
R191  47K  [Res0402]
R192  47K  [Res0402]
R193  47K  [Res0402]
R194  47K  [Res0402]
R195  47K  [Res0402]
R196  47K  [Res0402]
R197  47K  [Res0402]
R198  47K  [Res0402]
R199  47K  [Res0402]
R200  47K  [Res0402]
R201  47K  [Res0402]
R202  47K  [Res0402]
R203  47K  [Res0402]
R204  47K  [Res0402]
R205  47K  [Res0402]
R206  47K  [Res0402]
R207  47K  [Res0402]
R208  47K  [Res0402]

### Blocks framed on the sheet
PULL UP RESISTOR FOR I2C SIGNAL LINES: R145-R208

### Ports
MUX_6 (bidir, harness MUX_6), MUX_7 (bidir, harness MUX_7), MUX_8 (bidir, harness MUX_8), MUX_9 (bidir, harness MUX_9), VCC_3V3

### Harnesses
MUX_7: SDA_49, SDA_50, SDA_51, SDA_52, SDA_53, SDA_54, SDA_55, SDA_56, SCL_49, SCL_50, SCL_51, SCL_52, SCL_53, SCL_54, SCL_55, SCL_56
MUX_8: SDA_57, SDA_58, SDA_59, SDA_60, SDA_61, SDA_62, SDA_63, SDA_64, SCL_57, SCL_58, SCL_59, SCL_60, SCL_61, SCL_62, SCL_63, SCL_64
MUX_9: SDA_65, SDA_66, SDA_67, SDA_68, SDA_69, SDA_70, SDA_71, SDA_72, SCL_65, SCL_66, SCL_67, SCL_68, SCL_69, SCL_70, SCL_71, SCL_72
MUX_6: SDA_41, SDA_42, SDA_43, SDA_44, SDA_45, SDA_46, SDA_47, SDA_48, SCL_41, SCL_42, SCL_43, SCL_44, SCL_45, SCL_46, SCL_47, SCL_48

### Nets
VCC_3V3: R145.2 R146.2 R147.2 R148.2 R149.2 R150.2 R151.2 R152.2 R153.2 R154.2 R155.2 R156.2 R157.2 R158.2 R159.2 R160.2 R161.2 R162.2 R163.2 R164.2 R165.2 R166.2 R167.2 R168.2 R169.2 R170.2 R171.2 R172.2 R173.2 R174.2 R175.2 R176.2 R177.2 R178.2 R179.2 R180.2 R181.2 R182.2 R183.2 R184.2 R185.2 R186.2 R187.2 R188.2 R189.2 R190.2 R191.2 R192.2 R193.2 R194.2 R195.2 R196.2 R197.2 R198.2 R199.2 R200.2 R201.2 R202.2 R203.2 R204.2 R205.2 R206.2 R207.2 R208.2 ; port VCC_3V3
SCL_41: R149.1 ; port MUX_6.SCL_41  [project net MUX_6.SCL_41]
SCL_42: R157.1 ; port MUX_6.SCL_42  [project net MUX_6.SCL_42]
SCL_43: R165.1 ; port MUX_6.SCL_43  [project net MUX_6.SCL_43]
SCL_44: R173.1 ; port MUX_6.SCL_44  [project net MUX_6.SCL_44]
SCL_45: R181.1 ; port MUX_6.SCL_45  [project net MUX_6.SCL_45]
SCL_46: R189.1 ; port MUX_6.SCL_46  [project net MUX_6.SCL_46]
SCL_47: R197.1 ; port MUX_6.SCL_47  [project net MUX_6.SCL_47]
SCL_48: R205.1 ; port MUX_6.SCL_48  [project net MUX_6.SCL_48]
SCL_49: R150.1 ; port MUX_7.SCL_49  [project net MUX_7.SCL_49]
SCL_50: R158.1 ; port MUX_7.SCL_50  [project net MUX_7.SCL_50]
SCL_51: R166.1 ; port MUX_7.SCL_51  [project net MUX_7.SCL_51]
SCL_52: R174.1 ; port MUX_7.SCL_52  [project net MUX_7.SCL_52]
SCL_53: R182.1 ; port MUX_7.SCL_53  [project net MUX_7.SCL_53]
SCL_54: R190.1 ; port MUX_7.SCL_54  [project net MUX_7.SCL_54]
SCL_55: R198.1 ; port MUX_7.SCL_55  [project net MUX_7.SCL_55]
SCL_56: R206.1 ; port MUX_7.SCL_56  [project net MUX_7.SCL_56]
SCL_57: R151.1 ; port MUX_8.SCL_57  [project net MUX_8.SCL_57]
SCL_58: R159.1 ; port MUX_8.SCL_58  [project net MUX_8.SCL_58]
SCL_59: R167.1 ; port MUX_8.SCL_59  [project net MUX_8.SCL_59]
SCL_60: R175.1 ; port MUX_8.SCL_60  [project net MUX_8.SCL_60]
SCL_61: R183.1 ; port MUX_8.SCL_61  [project net MUX_8.SCL_61]
SCL_62: R191.1 ; port MUX_8.SCL_62  [project net MUX_8.SCL_62]
SCL_63: R199.1 ; port MUX_8.SCL_63  [project net MUX_8.SCL_63]
SCL_64: R207.1 ; port MUX_8.SCL_64  [project net MUX_8.SCL_64]
SCL_65: R152.1 ; port MUX_9.SCL_65  [project net MUX_9.SCL_65]
SCL_66: R160.1 ; port MUX_9.SCL_66  [project net MUX_9.SCL_66]
SCL_67: R168.1 ; port MUX_9.SCL_67  [project net MUX_9.SCL_67]
SCL_68: R176.1 ; port MUX_9.SCL_68  [project net MUX_9.SCL_68]
SCL_69: R184.1 ; port MUX_9.SCL_69  [project net MUX_9.SCL_69]
SCL_70: R192.1 ; port MUX_9.SCL_70  [project net MUX_9.SCL_70]
SCL_71: R200.1 ; port MUX_9.SCL_71  [project net MUX_9.SCL_71]
SCL_72: R208.1 ; port MUX_9.SCL_72  [project net MUX_9.SCL_72]
SDA_41: R145.1 ; port MUX_6.SDA_41  [project net MUX_6.SDA_41]
SDA_42: R153.1 ; port MUX_6.SDA_42  [project net MUX_6.SDA_42]
SDA_43: R161.1 ; port MUX_6.SDA_43  [project net MUX_6.SDA_43]
SDA_44: R169.1 ; port MUX_6.SDA_44  [project net MUX_6.SDA_44]
SDA_45: R177.1 ; port MUX_6.SDA_45  [project net MUX_6.SDA_45]
SDA_46: R185.1 ; port MUX_6.SDA_46  [project net MUX_6.SDA_46]
SDA_47: R193.1 ; port MUX_6.SDA_47  [project net MUX_6.SDA_47]
SDA_48: R201.1 ; port MUX_6.SDA_48  [project net MUX_6.SDA_48]
SDA_49: R146.1 ; port MUX_7.SDA_49  [project net MUX_7.SDA_49]
SDA_50: R154.1 ; port MUX_7.SDA_50  [project net MUX_7.SDA_50]
SDA_51: R162.1 ; port MUX_7.SDA_51  [project net MUX_7.SDA_51]
SDA_52: R170.1 ; port MUX_7.SDA_52  [project net MUX_7.SDA_52]
SDA_53: R178.1 ; port MUX_7.SDA_53  [project net MUX_7.SDA_53]
SDA_54: R186.1 ; port MUX_7.SDA_54  [project net MUX_7.SDA_54]
SDA_55: R194.1 ; port MUX_7.SDA_55  [project net MUX_7.SDA_55]
SDA_56: R202.1 ; port MUX_7.SDA_56  [project net MUX_7.SDA_56]
SDA_57: R147.1 ; port MUX_8.SDA_57  [project net MUX_8.SDA_57]
SDA_58: R155.1 ; port MUX_8.SDA_58  [project net MUX_8.SDA_58]
SDA_59: R163.1 ; port MUX_8.SDA_59  [project net MUX_8.SDA_59]
SDA_60: R171.1 ; port MUX_8.SDA_60  [project net MUX_8.SDA_60]
SDA_61: R179.1 ; port MUX_8.SDA_61  [project net MUX_8.SDA_61]
SDA_62: R187.1 ; port MUX_8.SDA_62  [project net MUX_8.SDA_62]
SDA_63: R195.1 ; port MUX_8.SDA_63  [project net MUX_8.SDA_63]
SDA_64: R203.1 ; port MUX_8.SDA_64  [project net MUX_8.SDA_64]
SDA_65: R148.1 ; port MUX_9.SDA_65  [project net MUX_9.SDA_65]
SDA_66: R156.1 ; port MUX_9.SDA_66  [project net MUX_9.SDA_66]
SDA_67: R164.1 ; port MUX_9.SDA_67  [project net MUX_9.SDA_67]
SDA_68: R172.1 ; port MUX_9.SDA_68  [project net MUX_9.SDA_68]
SDA_69: R180.1 ; port MUX_9.SDA_69  [project net MUX_9.SDA_69]
SDA_70: R188.1 ; port MUX_9.SDA_70  [project net MUX_9.SDA_70]
SDA_71: R196.1 ; port MUX_9.SDA_71  [project net MUX_9.SDA_71]
SDA_72: R204.1 ; port MUX_9.SDA_72  [project net MUX_9.SDA_72]

### Notes on the sheet
- OLED SIGNALS
- 1
- Huzaifa Ali

### Library data of the parts
R145-R208 = RC0402FR-0747KL: as R43-R109 on sheet RPull_Section; Supplier 1: Digi-Key; Manufacturer Part Number: RC0402FR-0747KL; Stock 1: 0; Pricing 1: 1=0.1, 10=0.016, 100=0.0064, 1000=0.00289, 2500=0.00251, 5000=0.00207 (USD); Case/Package: 0402; Case Code (Imperial): 0402; Case Code (Metric): 1005; Min Operating Temperature: -55°C; Max Operating Temperature: 155°C; Tolerance: 1%; Packaging: Tape and Reel; Package Quantity: 1; Termination: SMD/SMT; Composition: Thick Film; Number of Terminations: 2; Military Standard: Not; Features: Moisture Resistant; Length: 1mm; Height: 0.016inch; Depth: 0.5mm; Width: 0.5mm; REACH SVHC: Unknown; Lead Free: Lead Free; ComponentLink1URL: http://www.yageo.com/documents/recent/PYu-RC0402_51_RoHS_L_6_r.pdf?src-supplier=Future+Electronics; ComponentLink1Description: http://www.yageo.com/documents/recent/PYu-RC0402_51_RoHS_L_6_r.pdf?src-supplier=Future+Electronics; ComponentLink2URL: http://www.farnell.com/datasheets/1018594.pdf?src-supplier=Element14; ComponentLink2Description: http://www.farnell.com/datasheets/1018594.pdf?src-supplier=Element14; ComponentLink3URL: https://www.verical.com/server-webapp/html/getDatasheet?partID=323748&src-supplier=Verical; ComponentLink3Description: https://www.verical.com/server-webapp/html/getDatasheet?partID=323748&src-supplier=Verical; ComponentLink4URL: http://www.yageo.com/documents/recent/PYu-RC_Group_51_RoHS_L_10.pdf?src-supplier=Digi-Key; ComponentLink4Description: http://www.yageo.com/documents/recent/PYu-RC_Group_51_RoHS_L_10.pdf?src-supplier=Digi-Key; Supplier Part Number 1: 311-47.0KLRDKR-ND

## Sheet Mux_Sheet _3.SchDoc
size A4
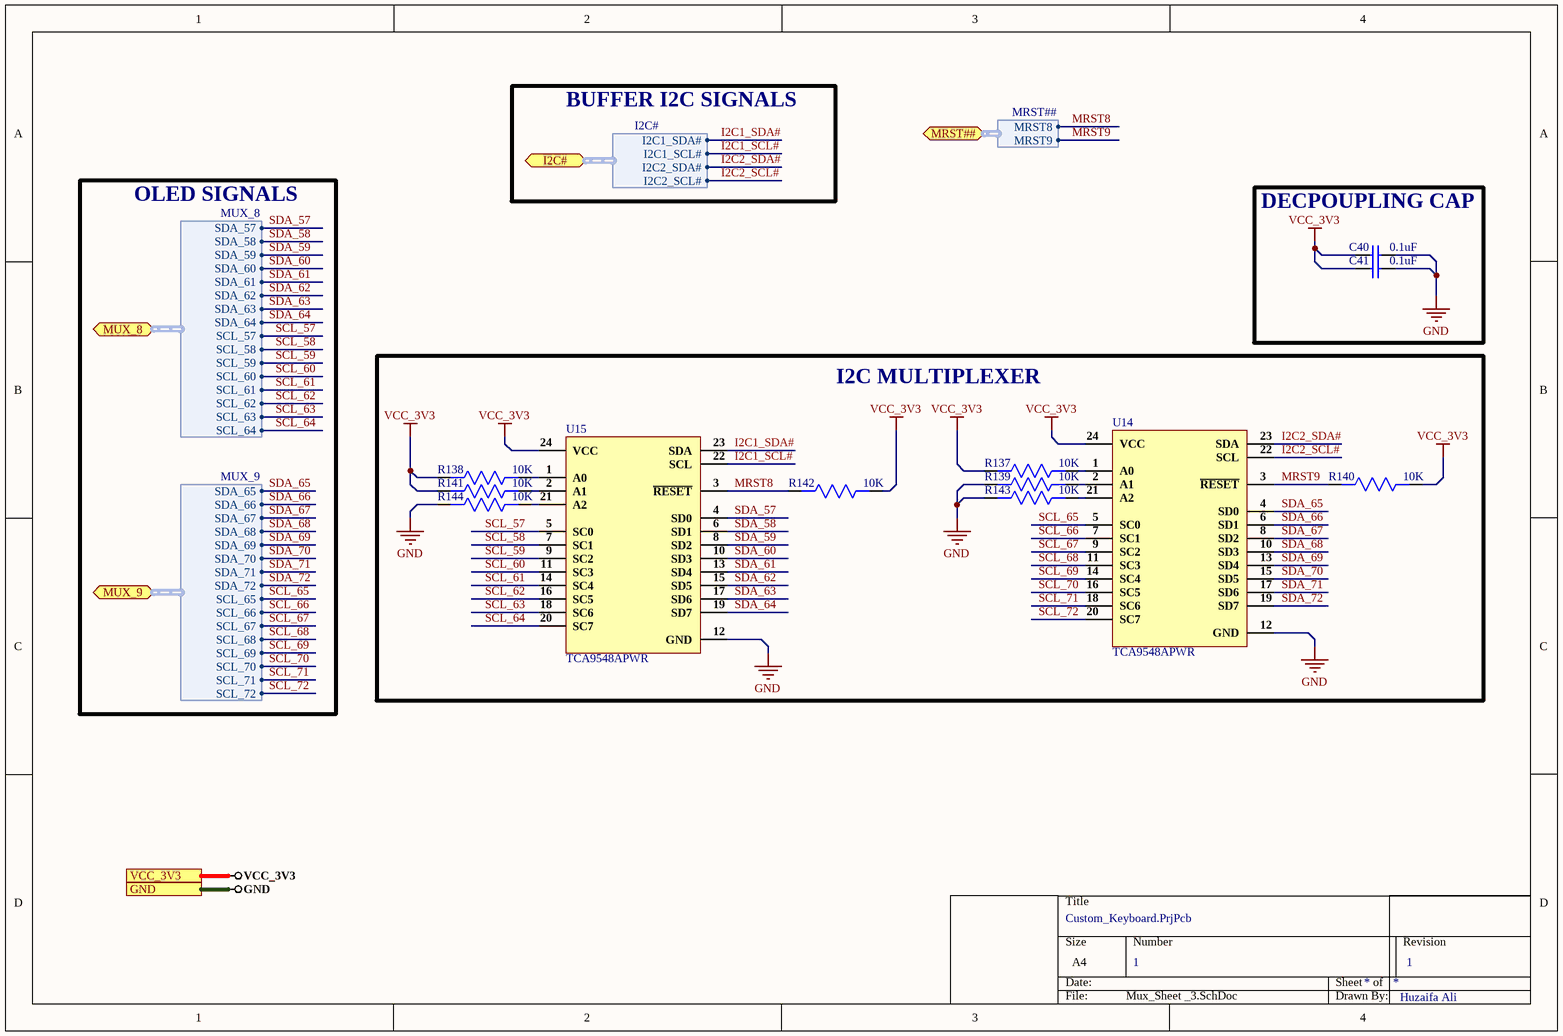
[diagram p13: Mux_Sheet _3.SchDoc]

### Parts
C40  0.1uF  [Cap0603]
C41  0.1uF  [Cap0603]
R137  10K  [Res0603]
R138  10K  [Res0603]
R139  10K  [Res0603]
R140  10K  [Res0603]
R141  10K  [Res0603]
R142  10K  [Res0603]
R143  10K  [Res0603]
R144  10K  [Res0603]
U14  TCA9548APWR  [24-TSSOP]
U15  TCA9548APWR  [24-TSSOP]

### Blocks framed on the sheet
DECPOUPLING CAP: C40 C41
I2C MULTIPLEXER: R137-R144 U14 U15

### Ports
GND, I2C# (bidir, harness I2C#), MRST## (bidir, harness MRST##), MUX_8 (bidir, harness MUX_8), MUX_9 (bidir, harness MUX_9), VCC_3V3

### Harnesses
I2C#: I2C1_SDA#, I2C1_SCL#, I2C2_SDA#, I2C2_SCL#
MUX_8: SDA_57, SDA_58, SDA_59, SDA_60, SDA_61, SDA_62, SDA_63, SDA_64, SCL_57, SCL_58, SCL_59, SCL_60, SCL_61, SCL_62, SCL_63, SCL_64
MUX_9: SDA_65, SDA_66, SDA_67, SDA_68, SDA_69, SDA_70, SDA_71, SDA_72, SCL_65, SCL_66, SCL_67, SCL_68, SCL_69, SCL_70, SCL_71, SCL_72
MRST##: MRST8, MRST9

### Nets
GND: C40.2 C41.2 R139.2 R143.2 R144.2 U14.12(GND) U15.12(GND) ; port GND
VCC_3V3: C40.1 C41.1 R137.2 R138.2 R140.1 R141.2 R142.1 U14.24(VCC) U15.24(VCC) ; port VCC_3V3
I2C1_SCL#: U15.22(SCL) ; port I2C#.I2C1_SCL#  [project net I2C#.I2C1_SCL#]
I2C1_SDA#: U15.23(SDA) ; port I2C#.I2C1_SDA#  [project net I2C#.I2C1_SDA#]
I2C2_SCL#: U14.22(SCL) ; port I2C#.I2C2_SCL#  [project net I2C#.I2C2_SCL#]
I2C2_SDA#: U14.23(SDA) ; port I2C#.I2C2_SDA#  [project net I2C#.I2C2_SDA#]
MRST8: R142.2 U15.3(~{RESET}) ; port MRST##.MRST8  [project net MRST##.MRST8]
MRST9: R140.2 U14.3(~{RESET}) ; port MRST##.MRST9  [project net MRST##.MRST9]
SCL_57: U15.5(SC0) ; port MUX_8.SCL_57  [project net MUX_8.SCL_57]
SCL_58: U15.7(SC1) ; port MUX_8.SCL_58  [project net MUX_8.SCL_58]
SCL_59: U15.9(SC2) ; port MUX_8.SCL_59  [project net MUX_8.SCL_59]
SCL_60: U15.11(SC3) ; port MUX_8.SCL_60  [project net MUX_8.SCL_60]
SCL_61: U15.14(SC4) ; port MUX_8.SCL_61  [project net MUX_8.SCL_61]
SCL_62: U15.16(SC5) ; port MUX_8.SCL_62  [project net MUX_8.SCL_62]
SCL_63: U15.18(SC6) ; port MUX_8.SCL_63  [project net MUX_8.SCL_63]
SCL_64: U15.20(SC7) ; port MUX_8.SCL_64  [project net MUX_8.SCL_64]
SCL_65: U14.5(SC0) ; port MUX_9.SCL_65  [project net MUX_9.SCL_65]
SCL_66: U14.7(SC1) ; port MUX_9.SCL_66  [project net MUX_9.SCL_66]
SCL_67: U14.9(SC2) ; port MUX_9.SCL_67  [project net MUX_9.SCL_67]
SCL_68: U14.11(SC3) ; port MUX_9.SCL_68  [project net MUX_9.SCL_68]
SCL_69: U14.14(SC4) ; port MUX_9.SCL_69  [project net MUX_9.SCL_69]
SCL_70: U14.16(SC5) ; port MUX_9.SCL_70  [project net MUX_9.SCL_70]
SCL_71: U14.18(SC6) ; port MUX_9.SCL_71  [project net MUX_9.SCL_71]
SCL_72: U14.20(SC7) ; port MUX_9.SCL_72  [project net MUX_9.SCL_72]
SDA_57: U15.4(SD0) ; port MUX_8.SDA_57  [project net MUX_8.SDA_57]
SDA_58: U15.6(SD1) ; port MUX_8.SDA_58  [project net MUX_8.SDA_58]
SDA_59: U15.8(SD2) ; port MUX_8.SDA_59  [project net MUX_8.SDA_59]
SDA_60: U15.10(SD3) ; port MUX_8.SDA_60  [project net MUX_8.SDA_60]
SDA_61: U15.13(SD4) ; port MUX_8.SDA_61  [project net MUX_8.SDA_61]
SDA_62: U15.15(SD5) ; port MUX_8.SDA_62  [project net MUX_8.SDA_62]
SDA_63: U15.17(SD6) ; port MUX_8.SDA_63  [project net MUX_8.SDA_63]
SDA_64: U15.19(SD7) ; port MUX_8.SDA_64  [project net MUX_8.SDA_64]
SDA_65: U14.4(SD0) ; port MUX_9.SDA_65  [project net MUX_9.SDA_65]
SDA_66: U14.6(SD1) ; port MUX_9.SDA_66  [project net MUX_9.SDA_66]
SDA_67: U14.8(SD2) ; port MUX_9.SDA_67  [project net MUX_9.SDA_67]
SDA_68: U14.10(SD3) ; port MUX_9.SDA_68  [project net MUX_9.SDA_68]
SDA_69: U14.13(SD4) ; port MUX_9.SDA_69  [project net MUX_9.SDA_69]
SDA_70: U14.15(SD5) ; port MUX_9.SDA_70  [project net MUX_9.SDA_70]
SDA_71: U14.17(SD6) ; port MUX_9.SDA_71  [project net MUX_9.SDA_71]
SDA_72: U14.19(SD7) ; port MUX_9.SDA_72  [project net MUX_9.SDA_72]
NetR137_1: R137.1 U14.1(A0)
NetR138_1: R138.1 U15.1(A0)
NetR139_1: R139.1 U14.2(A1)
NetR141_1: R141.1 U15.2(A1)
NetR143_1: R143.1 U14.21(A2)
NetR144_1: R144.1 U15.21(A2)

### Notes on the sheet
- BUFFER I2C SIGNALS
- OLED SIGNALS
- 1
- Huzaifa Ali

### Library data of the parts
C40 C41 = CC0603ZRY5V9BB104: CAP CER 0.1UF 50V Y5V 0603; Manufacturer: Yageo; Capacitance: 100nF; Tolerance: 80%; Supplier 1: Digi-Key; Manufacturer Part Number: CC0603ZRY5V9BB104; Stock 1: 15000880; Pricing 1: 1=0.1, 10=0.075, 100=0.0334, 500=0.02386, 1000=0.01874 (USD); Mount: Surface Mount; Case/Package: 0603; Number of Pins: 2; Case Code (Metric): 1608; Case Code (Imperial): 0603; Min Operating Temperature: -30°C; Max Operating Temperature: 85°C; Dielectric: Y5V; Voltage Rating: 50V; Package Quantity: 1; Packaging: Tape and Reel; Voltage Rating (DC): 50V; Termination: SMD/SMT; Composition: Ceramic; Voltage: 50V; Length: 1.6mm; Height: 0.8mm; Width: 0.031inch; Thickness: 0.035inch; Depth: 0.8mm; Radiation Hardening: No; REACH SVHC: No SVHC; Lead Free: Lead Free; Halogen Free: Halogen Free; ComponentLink1URL: http://www.yageo.com/documents/recent/UPY-GPHC_Y5V_6.3V-to-50V_8.pdf?src-supplier=Digi-Key; ComponentLink1Description: http://www.yageo.com/documents/recent/UPY-GPHC_Y5V_6.3V-to-50V_8.pdf?src-supplier=Digi-Key; ComponentLink2URL: http://www.yageo.com/documents/recent/UPY-GPHC_Y5V_6.3V-to-50V_5.pdf?src-supplier=Avnet+Europe; ComponentLink2Description: http://www.yageo.com/documents/recent/UPY-GPHC_Y5V_6.3V-to-50V_5.pdf?src-supplier=Avnet+Europe; ComponentLink3URL: https://www.verical.com/server-webapp/html/getDatasheet?partID=403611&src-supplier=Verical; ComponentLink3Description: https://www.verical.com/server-webapp/html/getDatasheet?partID=403611&src-supplier=Verical; ComponentLink4URL: http://www.mouser.com/ds/2/447/Yageo_UPY-GP_NP0_16V-to-50V_9-358835.pdf?src-supplier=Mouser; ComponentLink4Description: http://www.mouser.com/ds/2/447/Yageo_UPY-GP_NP0_16V-to-50V_9-358835.pdf?src-supplier=Mouser; ComponentLink5URL: http://www.farnell.com/datasheets/1132289.pdf?src-supplier=Element14; ComponentLink5Description: http://www.farnell.com/datasheets/1132289.pdf?src-supplier=Element14; Supplier Part Number 1: 311-1343-1-ND
R137-R144 = AC0603JR-0710KL: RES SMD 10K OHM 5% 1/10W 0603; Manufacturer: Yageo; Voltage Rating: 50V; Resistance: 10kR; Power Rating: 100mW; Temperature Coefficient: 100ppm/°C; Supplier 1: Future Electronics; Manufacturer Part Number: AC0603JR-0710KL; RoHS: Yes; Category: Chip SMD Resistors; Stock 1: 1533000; Pricing 1: 5000=0.00540 (USD); Case/Package: 0603; Case Code (Imperial): 0603; Case Code (Metric): 1608; Size Code: 0603; Min Operating Temperature: -55°C; Max Operating Temperature: 155°C; Packaging: Tape and Reel; Tolerance: 5%; Package Quantity: 1; Resistor Type: Thick Film; Termination: SMD/SMT; Number of Terminations: 2; Max Power Dissipation: 100mW; Features: Moisture Resistant,Automotive AEC-Q200,Anti-Sulfur; Series: AC; Construction: Rectangular; Length: 0.063inch; Width: 0.031inch; Height: 0.022inch; Depth: 0.8mm; Military Standard: Not; Lead Free: Lead Free; RoHS Compliant: Yes; ComponentLink1URL: https://datasheet.ciiva.com/5562/pyu-ac-51-rohs-l-2-5562553.pdf?src-supplier=Mouser; ComponentLink1Description: https://datasheet.ciiva.com/5562/pyu-ac-51-rohs-l-2-5562553.pdf?src-supplier=Mouser; Supplier Part Number 1: 1029044
U14 U15 = TCA9548APWR: IC BUS SWITCH 1 X 8:1 24TSSOP; Manufacturer: Texas Instruments; Max Supply Voltage: 5.5V; Min Supply Voltage: 1.65V; On-State Resistance: 70R; Max Supply Current: 80uA; Supply Type: Single; Independent Circuits: 1; Supplier 1: Digi-Key; Manufacturer Part Number: TCA9548APWR; RoHS: Yes; Category: Decoders and Multiplexers; Pricing 1: 1=2.09000, 10=1.87600, 25=1.77040, 100=1.50820, 250=1.41616, 500=1.23914, 1000=1.16900 (USD); Mount: Surface Mount; Case/Package: TSSOP; Number of Pins: 24; Contact Plating: Gold; Min Operating Temperature: -40°C; Max Operating Temperature: 85°C; Packaging: Tape and Reel; Package Quantity: 1; REACH SVHC: No SVHC; Lead Free: Lead Free; ComponentLink1URL: https://datasheet.ciiva.com/6614/tca9548a-6614721.pdf?src-supplier=Digi-Key; ComponentLink1Description: https://datasheet.ciiva.com/6614/tca9548a-6614721.pdf?src-supplier=Digi-Key; Supplier Part Number 1: 296-34905-1-ND